# Altium schematic sheet KF127-5.08-2P.schdoc
size 127 x 101 mm
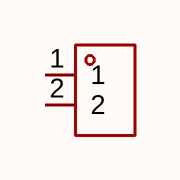
[diagram p0: KF127-5.08-2P.schdoc]

## Parts
U?  kf127-5.08-2p  [CONN-TH_P5.08_KF127-5.08-2P]  (value not drawn)

## Nets

Not connected (* = marked no-connect by the designer): U? 1 2

## Library data of the parts
U? = kf127-5.08-2p: 结构:1x2P;间距:5.08mm;颜色:绿色;安装类型:直插;排数:1;每排PIN数:2;额定电流:15A;额定电压:250V;线规 - AWG:14~26;线规 - 平方毫米:1.5;工作温度:-40℃~+105℃;; Manufacturer: KEFA(科发); AddInBom: yes; ModelId: 8255fe6a846243dab855f08302b3b8d1; ModelTransform: 422.4401,322.834,0,0,0,0,11.929,0,-137.795; Number of Positions or Pins: 1x2P; Pitch: 5.08mm; Number of PINs Per Row: 2; Screw Specification: M2.5; Current Rating: 15A; Voltage Rating (Max): 250V; Wire Gauge - AWG: 14~26; Wire Gauge - mm2: 1.5; Symbol: KF127-5.08-2P; LCSC Part Name: 1x2P 5.08mm 直插 排数:1 每排P数:2; SupplierPart: C474906; ManufacturerPart: KF127-5.08-2P; Supplier Footprint: 插件,P=5.08mm; JLCPCB Part Class: Extended Part; Datasheet: https://item.szlcsc.com/datasheet/KF127-5.08-2P/481524.html; Supplier: LCSC; ConvertToPcb: yes; FootprintName: CONN-TH_P5.08_KF127-5.08-2P; ModelName: CONN-TH_P5.08_KF127-5.08-2P; Color: 绿色; Mounting Type: 直插; Number of Pins: 2P; Number of Rows: 1; Operating Temperature: -40℃~+105℃; Height Above Board: 10.1mm